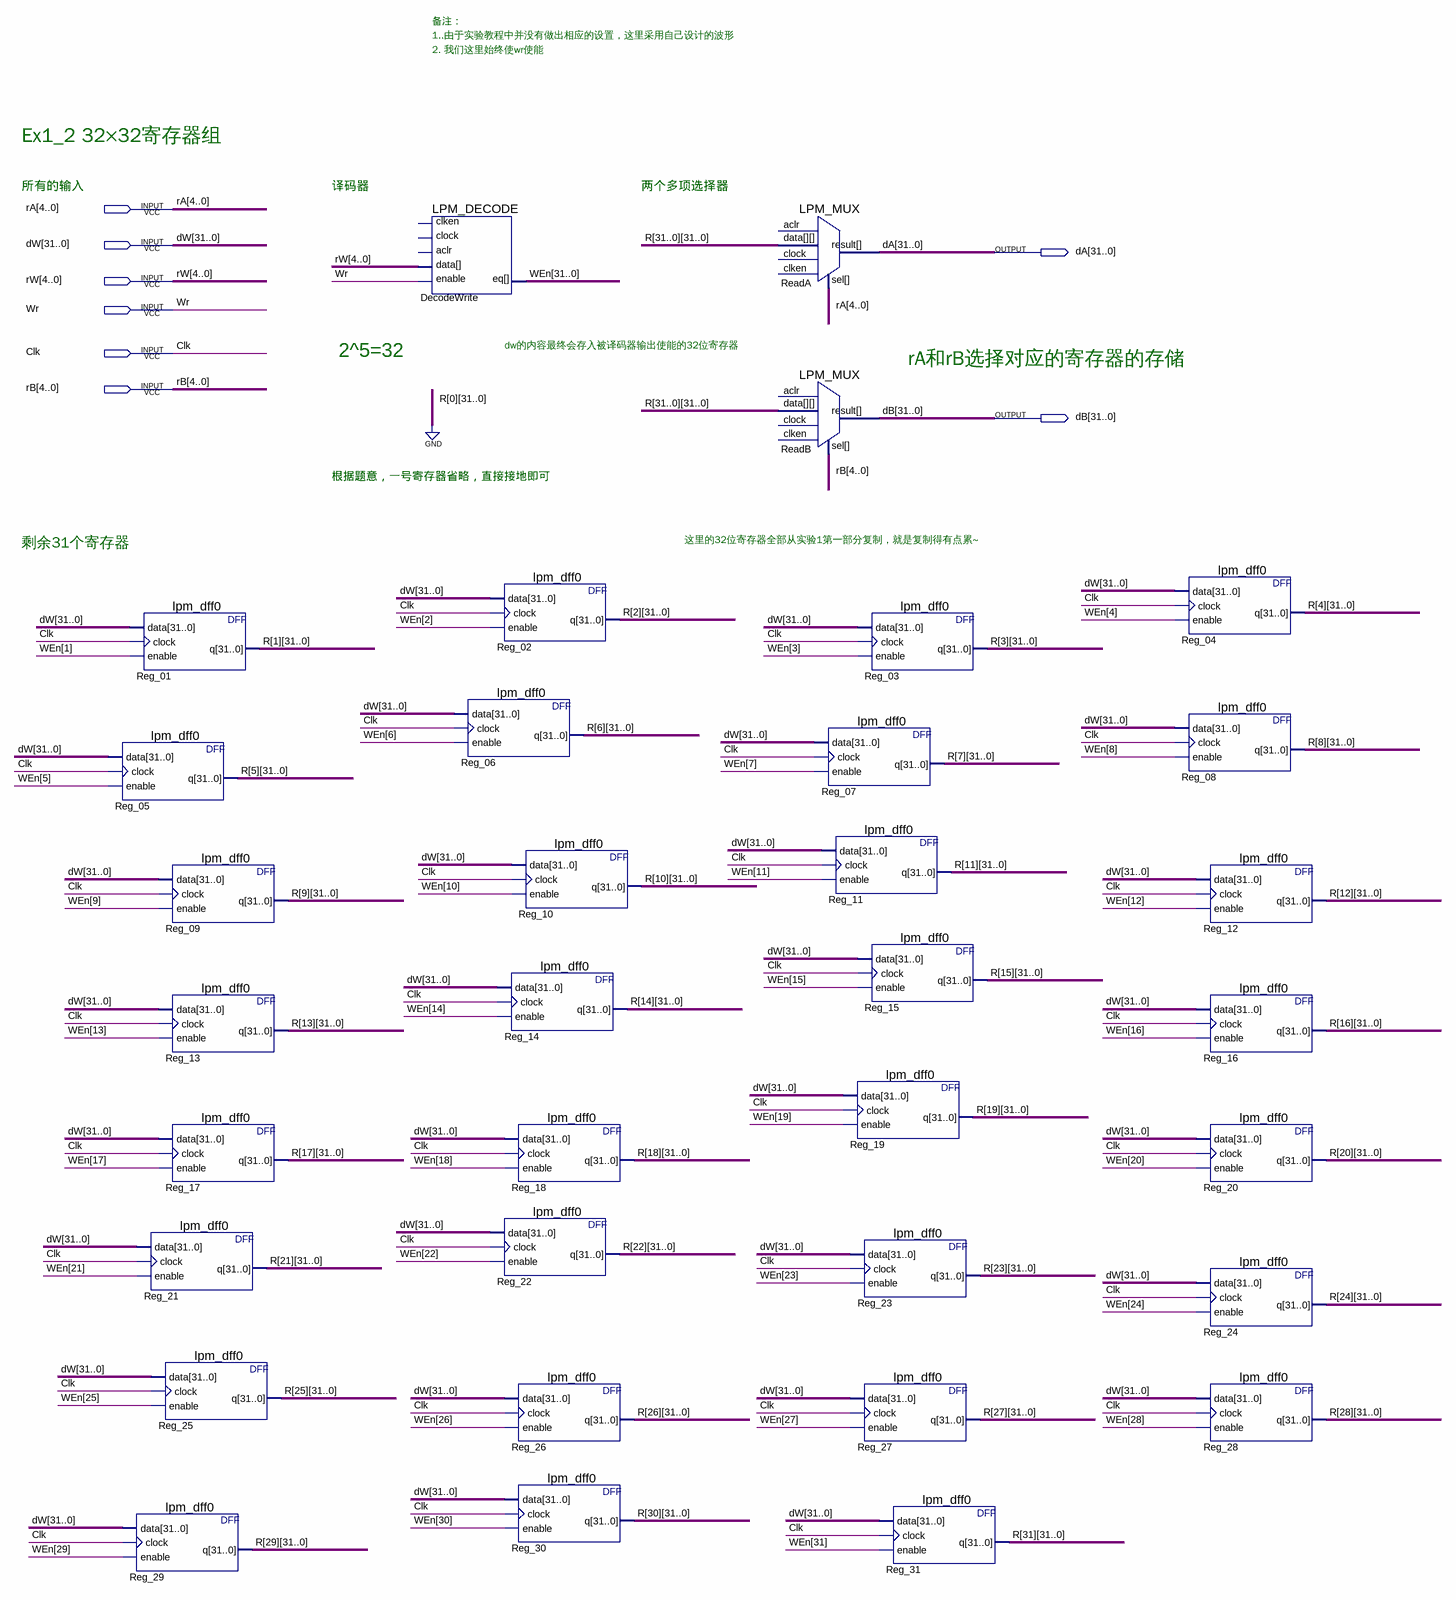
[diagram p0: schematic sheet]
// Quartus schematic GPRs.bdf as structural Verilog: 34 symbols, 8 pins
module GPRs (
  input  [4:0] rA,
  input  [31:0] dW,
  input  [4:0] rW,
  input  Wr,
  input  Clk,
  input  [4:0] rB,
  output [31:0] dA,
  output [31:0] dB
);

  wire [31:0] R_1, R_2, R_3, R_4, R_5, R_6, R_7, R_8, R_9, R_10, R_11, R_12, R_13, R_14, R_15, R_16, R_17,
       R_18, R_19, R_20, R_21, R_22, R_23, R_24, R_25, R_26, R_27, R_28, R_29, R_30, R_31, WEn;

  lpm_dff0 Reg_05 (.data(dW), .clock(Clk), .enable(WEn[5]), .q(R_5));
  lpm_dff0 Reg_01 (.data(dW), .clock(Clk), .enable(WEn[1]), .q(R_1));
  lpm_dff0 Reg_09 (.data(dW), .clock(Clk), .enable(WEn[9]), .q(R_9));
  lpm_dff0 Reg_13 (.data(dW), .clock(Clk), .enable(WEn[13]), .q(R_13));
  lpm_dff0 Reg_17 (.data(dW), .clock(Clk), .enable(WEn[17]), .q(R_17));
  lpm_dff0 Reg_21 (.data(dW), .clock(Clk), .enable(WEn[21]), .q(R_21));
  lpm_dff0 Reg_25 (.data(dW), .clock(Clk), .enable(WEn[25]), .q(R_25));
  lpm_dff0 Reg_29 (.data(dW), .clock(Clk), .enable(WEn[29]), .q(R_29));
  LPM_DECODE #(.LPM_DECODES(32), .LPM_PIPELINE(0), .LPM_WIDTH(5)) DecodeWrite (
    .enable(Wr), .data(rW), .eq(WEn));  // open: clken, clock, aclr
  lpm_dff0 Reg_06 (.data(dW), .clock(Clk), .enable(WEn[6]), .q(R_6));
  lpm_dff0 Reg_02 (.data(dW), .clock(Clk), .enable(WEn[2]), .q(R_2));
  lpm_dff0 Reg_10 (.data(dW), .clock(Clk), .enable(WEn[10]), .q(R_10));
  lpm_dff0 Reg_14 (.data(dW), .clock(Clk), .enable(WEn[14]), .q(R_14));
  lpm_dff0 Reg_18 (.data(dW), .clock(Clk), .enable(WEn[18]), .q(R_18));
  lpm_dff0 Reg_22 (.data(dW), .clock(Clk), .enable(WEn[22]), .q(R_22));
  lpm_dff0 Reg_26 (.data(dW), .clock(Clk), .enable(WEn[26]), .q(R_26));
  lpm_dff0 Reg_30 (.data(dW), .clock(Clk), .enable(WEn[30]), .q(R_30));
  LPM_MUX #(.LPM_PIPELINE(0), .LPM_SIZE(32), .LPM_WIDTH(32), .LPM_WIDTHS(5)) ReadA (
    .data({R_31, R_30, R_29, R_28, R_27, R_26, R_25, R_24, R_23, R_22, R_21, R_20, R_19, R_18, R_17, R_16, R_15, R_14, R_13, R_12, R_11, R_10, R_9, R_8, R_7, R_6, R_5, R_4, R_3, R_2, R_1, {32{1'b0}}}),
    .sel(rA), .result(dA));  // open: clock, aclr, clken
  LPM_MUX #(.LPM_PIPELINE(0), .LPM_SIZE(32), .LPM_WIDTH(32), .LPM_WIDTHS(5)) ReadB (
    .data({R_31, R_30, R_29, R_28, R_27, R_26, R_25, R_24, R_23, R_22, R_21, R_20, R_19, R_18, R_17, R_16, R_15, R_14, R_13, R_12, R_11, R_10, R_9, R_8, R_7, R_6, R_5, R_4, R_3, R_2, R_1, {32{1'b0}}}),
    .sel(rB), .result(dB));  // open: clock, aclr, clken
  lpm_dff0 Reg_03 (.data(dW), .clock(Clk), .enable(WEn[3]), .q(R_3));
  lpm_dff0 Reg_07 (.data(dW), .clock(Clk), .enable(WEn[7]), .q(R_7));
  lpm_dff0 Reg_11 (.data(dW), .clock(Clk), .enable(WEn[11]), .q(R_11));
  lpm_dff0 Reg_15 (.data(dW), .clock(Clk), .enable(WEn[15]), .q(R_15));
  lpm_dff0 Reg_19 (.data(dW), .clock(Clk), .enable(WEn[19]), .q(R_19));
  lpm_dff0 Reg_23 (.data(dW), .clock(Clk), .enable(WEn[23]), .q(R_23));
  lpm_dff0 Reg_27 (.data(dW), .clock(Clk), .enable(WEn[27]), .q(R_27));
  lpm_dff0 Reg_31 (.data(dW), .clock(Clk), .enable(WEn[31]), .q(R_31));
  lpm_dff0 Reg_04 (.data(dW), .clock(Clk), .enable(WEn[4]), .q(R_4));
  lpm_dff0 Reg_08 (.data(dW), .clock(Clk), .enable(WEn[8]), .q(R_8));
  lpm_dff0 Reg_12 (.data(dW), .clock(Clk), .enable(WEn[12]), .q(R_12));
  lpm_dff0 Reg_16 (.data(dW), .clock(Clk), .enable(WEn[16]), .q(R_16));
  lpm_dff0 Reg_20 (.data(dW), .clock(Clk), .enable(WEn[20]), .q(R_20));
  lpm_dff0 Reg_24 (.data(dW), .clock(Clk), .enable(WEn[24]), .q(R_24));
  lpm_dff0 Reg_28 (.data(dW), .clock(Clk), .enable(WEn[28]), .q(R_28));

  // Notes on the sheet:
  //   备注：
  //   1..由于实验教程中并没有做出相应的设置，这里采用自己设计的波形
  //   2. 我们这里始终使wr使能
  //   Ex1_2 32×32寄存器组
  //   所有的输入
  //   译码器
  //   两个多项选择器
  //   2^5=32
  //   dw的内容最终会存入被译码器输出使能的32位寄存器
  //   rA和rB选择对应的寄存器的存储
  //   根据题意，一号寄存器省略，直接接地即可
  //   剩余31个寄存器
  //   这里的32位寄存器全部从实验1第一部分复制，就是复制得有点累~
endmodule
